# Altium project MVP-Dash-v1.0.PrjPcb (part 8 of 15)

## Sheet DRAM-LPDDR4x-Sheet.SchDoc
size 420 x 297 mm; SheetNumber: 16; SheetTotal: 25
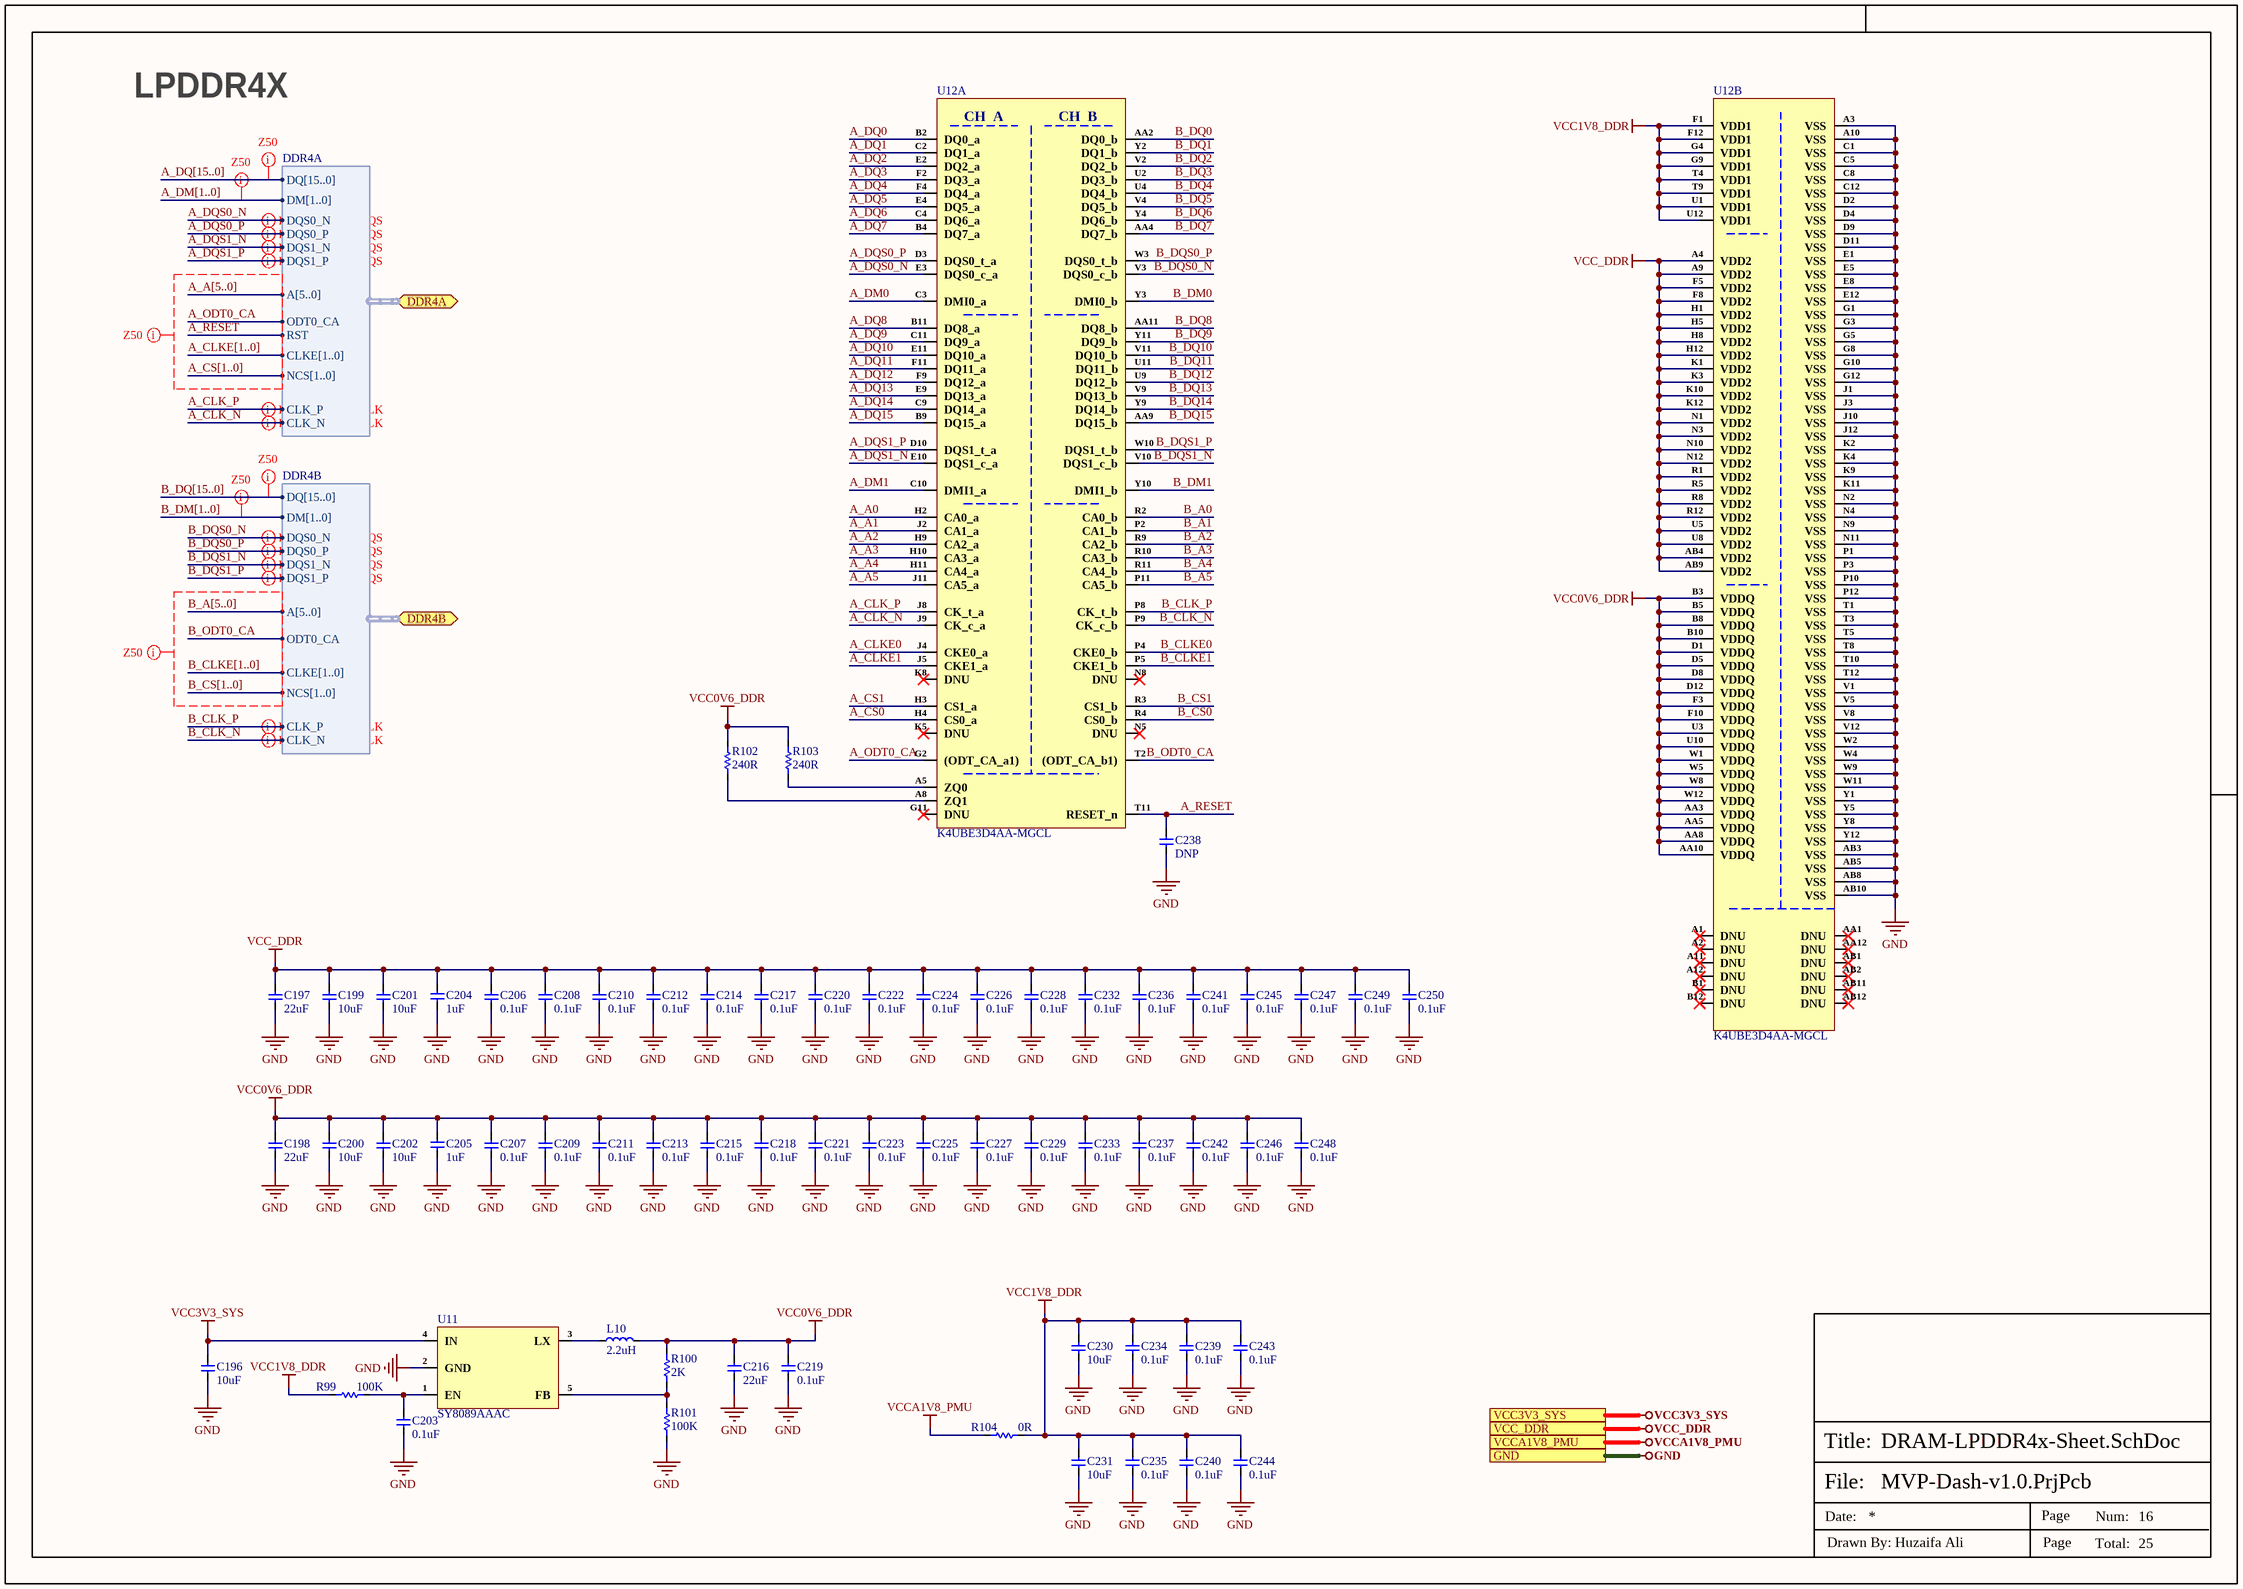
[diagram p20: DRAM-LPDDR4x-Sheet.SchDoc]

### Parts
C196  10uF  [Cap-0603]
C197  22uF  [Cap-0603]
C198  22uF  [Cap-0603]
C199  10uF  [Cap-0603]
C200  10uF  [Cap-0603]
C201  10uF  [Cap-0603]
C202  10uF  [Cap-0603]
C203  0.1uF  [Cap-0402]
C204  1uF  [Cap-0402]
C205  1uF  [Cap-0402]
C206  0.1uF  [Cap-0402]
C207  0.1uF  [Cap-0402]
C208  0.1uF  [Cap-0402]
C209  0.1uF  [Cap-0402]
C210  0.1uF  [Cap-0402]
C211  0.1uF  [Cap-0402]
C212  0.1uF  [Cap-0402]
C213  0.1uF  [Cap-0402]
C214  0.1uF  [Cap-0402]
C215  0.1uF  [Cap-0402]
C216  22uF  [Cap-0603]
C217  0.1uF  [Cap-0402]
C218  0.1uF  [Cap-0402]
C219  0.1uF  [Cap-0402]
C220  0.1uF  [Cap-0402]
C221  0.1uF  [Cap-0402]
C222  0.1uF  [Cap-0402]
C223  0.1uF  [Cap-0402]
C224  0.1uF  [Cap-0402]
C225  0.1uF  [Cap-0402]
C226  0.1uF  [Cap-0402]
C227  0.1uF  [Cap-0402]
C228  0.1uF  [Cap-0402]
C229  0.1uF  [Cap-0402]
C230  10uF  [Cap-0603]
C231  10uF  [Cap-0603]
C232  0.1uF  [Cap-0402]
C233  0.1uF  [Cap-0402]
C234  0.1uF  [Cap-0402]
C235  0.1uF  [Cap-0402]
C236  0.1uF  [Cap-0402]
C237  0.1uF  [Cap-0402]
C238  DNP  [Cap-0402]
C239  0.1uF  [Cap-0402]
C240  0.1uF  [Cap-0402]
C241  0.1uF  [Cap-0402]
C242  0.1uF  [Cap-0402]
C243  0.1uF  [Cap-0402]
C244  0.1uF  [Cap-0402]
C245  0.1uF  [Cap-0402]
C246  0.1uF  [Cap-0402]
C247  0.1uF  [Cap-0402]
C248  0.1uF  [Cap-0402]
C249  0.1uF  [Cap-0402]
C250  0.1uF  [Cap-0402]
L10  2.2uH  [WPN4020H2R2MT_]
R99  100K  [Res-0402]
R100  2K  [Res-0603]
R101  100K  [Res-0402]
R102  240R  [Res-0402]
R103  240R  [Res-0402]
R104  0R  [Res-0402]
U11  SY8089AAAC  [SOT-23-5]
U12  K4UBE3D4AA-MGCL  [200-WFBGA (10x14.5)]  (parts A,B of 2)

### Ports
DDR4A (bidir, harness DDR4A, see RK3568-DDR-PHY[3D]), DDR4B (bidir, harness DDR4B, see RK3568-DDR-PHY[4D]), GND (see Connector-Sheet[5D], eMMC-Sheet[4D], LED-Debug-Sheet[4D], MicroSD-SPI-Flash-Sheet[4D], Power-DC-IN-Sheet[4D], Power-Others-Sheet[4D], Power-PMIC-Sheet[4D], RK3568-Audio-Interface[4D], RK3568-Flash-SD-Controller[4D], RK3568-OSC-PMUIO-Sheet[5D], RK3568-Power-Sheet[4D], RK3568-SARADC-GPIO[4D], RK3568-USB-PCIe-Sheet[5D], RK3568-VI-Interface-Sheet[4D], RK3568-VO-Interface-1[4D], RK3568-VO-Interface-2[4D], Sensors-Sheet-1[4D], Sensors-Sheet-2[5D], Type-C-Sheet[4D], USB-Ports[4D], VO-HDMI2.0-TX-Sheet[4D], VO-LCM-MIPI-DSI-TX0[4D], WIFI-BT-SDIO-Sheet[4D]), VCC3V3_SYS (see Power-DC-IN-Sheet[4D], Power-PMIC-Sheet[3D], RK3568-SARADC-GPIO[4D]), VCC_DDR (see Power-PMIC-Sheet[3D]), VCCA1V8_PMU (see Power-PMIC-Sheet[4D], RK3568-OSC-PMUIO-Sheet[5D])

### Harnesses
DDR4A: DQ[15..0], DM[1..0], DQS0_N, DQS0_P, DQS1_N, DQS1_P, A[5..0], ODT0_CA, RST, CLKE[1..0], NCS[1..0], CLK_P, CLK_N
DDR4B: DQ[15..0], DM[1..0], DQS0_N, DQS0_P, DQS1_N, DQS1_P, A[5..0], ODT0_CA, CLKE[1..0], NCS[1..0], CLK_P, CLK_N

### Nets
GND: C196.1 C197.1 C198.1 C199.1 C200.1 C201.1 C202.1 C203.1 C204.2 C205.2 C206.1 C207.1 C208.1 C209.1 C210.1 C211.1 C212.1 C213.1 C214.1 C215.1 C216.1 C217.1 C218.1 C219.1 C220.1 C221.1 C222.1 C223.1 C224.1 C225.1 C226.1 C227.1 C228.1 C229.1 C230.1 C231.1 C232.1 C233.1 C234.1 C235.1 C236.1 C237.1 C238.1 C239.1 C240.1 C241.1 C242.1 C243.1 C244.1 C245.1 C246.1 C247.1 C248.1 C249.1 C250.1 R101.1 U11.2(GND) U12.A3(VSS) U12.A10(VSS) U12.AB3(VSS) U12.AB5(VSS) U12.AB8(VSS) U12.AB10(VSS) U12.C1(VSS) U12.C5(VSS) U12.C8(VSS) U12.C12(VSS) U12.D2(VSS) U12.D4(VSS) U12.D9(VSS) U12.D11(VSS) U12.E1(VSS) U12.E5(VSS) U12.E8(VSS) U12.E12(VSS) U12.G1(VSS) U12.G3(VSS) U12.G5(VSS) U12.G8(VSS) U12.G10(VSS) U12.G12(VSS) U12.J1(VSS) U12.J3(VSS) U12.J10(VSS) U12.J12(VSS) U12.K2(VSS) U12.K4(VSS) U12.K9(VSS) U12.K11(VSS) U12.N2(VSS) U12.N4(VSS) U12.N9(VSS) U12.N11(VSS) U12.P1(VSS) U12.P3(VSS) U12.P10(VSS) U12.P12(VSS) U12.T1(VSS) U12.T3(VSS) U12.T5(VSS) U12.T8(VSS) U12.T10(VSS) U12.T12(VSS) U12.V1(VSS) U12.V5(VSS) U12.V8(VSS) U12.V12(VSS) U12.W2(VSS) U12.W4(VSS) U12.W9(VSS) U12.W11(VSS) U12.Y1(VSS) U12.Y5(VSS) U12.Y8(VSS) U12.Y12(VSS) ; port GND
VCC0V6_DDR: C198.2 C200.2 C202.2 C205.1 C207.2 C209.2 C211.2 C213.2 C215.2 C216.2 C218.2 C219.2 C221.2 C223.2 C225.2 C227.2 C229.2 C233.2 C237.2 C242.2 C246.2 C248.2 L10.2 R100.2 R102.2 R103.2 U12.AA3(VDDQ) U12.AA5(VDDQ) U12.AA8(VDDQ) U12.AA10(VDDQ) U12.B3(VDDQ) U12.B5(VDDQ) U12.B8(VDDQ) U12.B10(VDDQ) U12.D1(VDDQ) U12.D5(VDDQ) U12.D8(VDDQ) U12.D12(VDDQ) U12.F3(VDDQ) U12.F10(VDDQ) U12.U3(VDDQ) U12.U10(VDDQ) U12.W1(VDDQ) U12.W5(VDDQ) U12.W8(VDDQ) U12.W12(VDDQ)
VCC1V8_DDR: C230.2 C231.2 C234.2 C235.2 C239.2 C240.2 C243.2 C244.2 R99.2 R104.2 U12.F1(VDD1) U12.F12(VDD1) U12.G4(VDD1) U12.G9(VDD1) U12.T4(VDD1) U12.T9(VDD1) U12.U1(VDD1) U12.U12(VDD1)
VCC3V3_SYS: C196.2 U11.4(IN) ; port VCC3V3_SYS
VCC_DDR: C197.2 C199.2 C201.2 C204.1 C206.2 C208.2 C210.2 C212.2 C214.2 C217.2 C220.2 C222.2 C224.2 C226.2 C228.2 C232.2 C236.2 C241.2 C245.2 C247.2 C249.2 C250.2 U12.A4(VDD2) U12.A9(VDD2) U12.AB4(VDD2) U12.AB9(VDD2) U12.F5(VDD2) U12.F8(VDD2) U12.H1(VDD2) U12.H5(VDD2) U12.H8(VDD2) U12.H12(VDD2) U12.K1(VDD2) U12.K3(VDD2) U12.K10(VDD2) U12.K12(VDD2) U12.N1(VDD2) U12.N3(VDD2) U12.N10(VDD2) U12.N12(VDD2) U12.R1(VDD2) U12.R5(VDD2) U12.R8(VDD2) U12.R12(VDD2) U12.U5(VDD2) U12.U8(VDD2) ; port VCC_DDR
VCCA1V8_PMU: R104.1 ; port VCCA1V8_PMU
A_A0: U12.H2(CA0_a)
A_A1: U12.J2(CA1_a)
A_A2: U12.H9(CA2_a)
A_A3: U12.H10(CA3_a)
A_A4: U12.H11(CA4_a)
A_A5: U12.J11(CA5_a)
A_CLK_N: U12.J9(CK_c_a) ; port DDR4A.CLK_N
A_CLK_P: U12.J8(CK_t_a) ; port DDR4A.CLK_P
A_CLKE0: U12.J4(CKE0_a)
A_CLKE1: U12.J5(CKE1_a)
A_CS0: U12.H4(CS0_a)
A_CS1: U12.H3(CS1_a)
A_DM0: U12.C3(DMI0_a)
A_DM1: U12.C10(DMI1_a)
A_DQ0: U12.B2(DQ0_a)
A_DQ1: U12.C2(DQ1_a)
A_DQ2: U12.E2(DQ2_a)
A_DQ3: U12.F2(DQ3_a)
A_DQ4: U12.F4(DQ4_a)
A_DQ5: U12.E4(DQ5_a)
A_DQ6: U12.C4(DQ6_a)
A_DQ7: U12.B4(DQ7_a)
A_DQ8: U12.B11(DQ8_a)
A_DQ9: U12.C11(DQ9_a)
A_DQ10: U12.E11(DQ10_a)
A_DQ11: U12.F11(DQ11_a)
A_DQ12: U12.F9(DQ12_a)
A_DQ13: U12.E9(DQ13_a)
A_DQ14: U12.C9(DQ14_a)
A_DQ15: U12.B9(DQ15_a)
A_DQS0_N: U12.E3(DQS0_c_a) ; port DDR4A.DQS0_N
A_DQS0_P: U12.D3(DQS0_t_a) ; port DDR4A.DQS0_P
A_DQS1_N: U12.E10(DQS1_c_a) ; port DDR4A.DQS1_N
A_DQS1_P: U12.D10(DQS1_t_a) ; port DDR4A.DQS1_P
A_ODT0_CA: U12.G2((ODT_CA_a1)) ; port DDR4A.ODT0_CA
A_RESET: C238.2 U12.T11(RESET_n) ; port DDR4A.RST
B_A0: U12.R2(CA0_b)
B_A1: U12.P2(CA1_b)
B_A2: U12.R9(CA2_b)
B_A3: U12.R10(CA3_b)
B_A4: U12.R11(CA4_b)
B_A5: U12.P11(CA5_b)
B_CLK_N: U12.P9(CK_c_b) ; port DDR4B.CLK_N
B_CLK_P: U12.P8(CK_t_b) ; port DDR4B.CLK_P
B_CLKE0: U12.P4(CKE0_b)
B_CLKE1: U12.P5(CKE1_b)
B_CS0: U12.R4(CS0_b)
B_CS1: U12.R3(CS1_b)
B_DM0: U12.Y3(DMI0_b)
B_DM1: U12.Y10(DMI1_b)
B_DQ0: U12.AA2(DQ0_b)
B_DQ1: U12.Y2(DQ1_b)
B_DQ2: U12.V2(DQ2_b)
B_DQ3: U12.U2(DQ3_b)
B_DQ4: U12.U4(DQ4_b)
B_DQ5: U12.V4(DQ5_b)
B_DQ6: U12.Y4(DQ6_b)
B_DQ7: U12.AA4(DQ7_b)
B_DQ8: U12.AA11(DQ8_b)
B_DQ9: U12.Y11(DQ9_b)
B_DQ10: U12.V11(DQ10_b)
B_DQ11: U12.U11(DQ11_b)
B_DQ12: U12.U9(DQ12_b)
B_DQ13: U12.V9(DQ13_b)
B_DQ14: U12.Y9(DQ14_b)
B_DQ15: U12.AA9(DQ15_b)
B_DQS0_N: U12.V3(DQS0_c_b) ; port DDR4B.DQS0_N
B_DQS0_P: U12.W3(DQS0_t_b) ; port DDR4B.DQS0_P
B_DQS1_N: U12.V10(DQS1_c_b) ; port DDR4B.DQS1_N
B_DQS1_P: U12.W10(DQS1_t_b) ; port DDR4B.DQS1_P
B_ODT0_CA: U12.T2((ODT_CA_b1)) ; port DDR4B.ODT0_CA
NetC203_2: C203.2 R99.1 U11.1(EN)
NetL10_1: L10.1 U11.3(LX)
NetR100_1: R100.1 R101.2 U11.5(FB)
NetR102_1: R102.1 U12.A8(ZQ1)
NetR103_1: R103.1 U12.A5(ZQ0)

Not connected (* = marked no-connect by the designer): U12 A1(DNU)* A2(DNU)* A11(DNU)* A12(DNU)* AA1(DNU)* AA12(DNU)* AB1(DNU)* AB2(DNU)* AB11(DNU)* AB12(DNU)* B1(DNU)* B12(DNU)* G11(DNU)* K5(DNU)* K8(DNU)* N5(DNU)* N8(DNU)*

### Buses and harness runs
bus A_A[5..0]
bus A_CLKE[1..0]
bus A_CS[1..0]
bus A_DM[1..0]
bus A_DQ[15..0]
bus B_A[5..0]
bus B_CLKE[1..0]
bus B_CS[1..0]
bus B_DM[1..0]
bus B_DQ[15..0]

### Layout directives
net class 50OHM_DDR: (no net found under the mark), A_A[5..0], A_CLKE[1..0], A_CS[1..0], A_ODT0_CA, A_RESET, B_A[5..0], B_CLKE[1..0], B_CS[1..0], B_ODT0_CA
differential pair; differential pair class 100OHM_DDR_DQS: A_DQS0_N, A_DQS0_P, A_DQS1_N, A_DQS1_P, B_DQS0_N, B_DQS0_P, B_DQS1_N, B_DQS1_P
differential pair; differential pair class 100OHM_DDR_CLK: A_CLK_N, A_CLK_P, B_CLK_N, B_CLK_P

### Notes on the sheet
- LPDDR4X
- File:
- Title:
- Date:
- Page
- Num:
- Total:
- Drawn By: Huzaifa Ali
- (in symbol K4UBE3D4AA-MGCL, part A) CH  A; CH  B

### Library data of the parts
C196 = CC0603KRX5R6BB106: CAP CER 10UF 10V X5R 0603; Manufacturer: Yageo; Tolerance: 10%; Item Type: Capacitor; Supplier 1: Digi-Key; Manufacturer Part Number: CC0603KRX5R6BB106; RoHS: Yes; Category: Ceramic Capacitors; Stock 1: 187515; Pricing 1: 1=0.24000, 10=0.16300, 50=0.09780, 100=0.08260, 500=0.05654, 1000=0.05001 (USD); Mount: Surface Mount; Case/Package: 0603; Case Code (Metric): 1608; Case Code (Imperial): 0603; Weight: 7.1E-05oz; Min Operating Temperature: -55°C; Max Operating Temperature: 85°C; Capacitance: 10uF; Packaging: Tape and Reel; Dielectric: X5R; Voltage Rating: 10V; Termination: SMD/SMT; Resistor Type: Ceramic; Voltage Rating (DC): 10V; Package Quantity: 4000; Length: 0.063inch; Width: 0.031inch; Thickness: 0.035inch; Depth: 0.8mm; Lead Free: Lead Free; Halogen Free: Halogen Free; RoHS Compliant: Yes; ComponentLink1URL: http://www.mouser.com/ds/2/447/Yageo_UPY-GP_NP0_16V-to-50V_9-358835.pdf?src-supplier=Mouser; ComponentLink1Description: http://www.mouser.com/ds/2/447/Yageo_UPY-GP_NP0_16V-to-50V_9-358835.pdf?src-supplier=Mouser; ComponentLink2URL: http://www.yageo.com/documents/recent/UPY-GPHC_X5R_4V-to-50V_25.pdf?src-supplier=Digi-Key; ComponentLink2Description: http://www.yageo.com/documents/recent/UPY-GPHC_X5R_4V-to-50V_25.pdf?src-supplier=Digi-Key; Supplier Part Number 1: 311-1782-1-ND; LCSC Part Number: C326057
C197 C198 C216 = CC0603MRX5R5BB226: CAP CER 22UF 6.3V X5R 0603; Manufacturer: Yageo; Tolerance: 20%; Supplier 1: Mouser; Manufacturer Part Number: CC0603MRX5R5BB226; RoHS: Yes; Category: Ceramic Capacitors; Stock 1: 3030; Pricing 1: 1=0.33000, 10=0.22500, 50=0.22500, 100=0.12800, 1000=0.07900, 10000=0.06500 (USD); Mount: Surface Mount; Case/Package: 0603; Case Code (Metric): 1608; Case Code (Imperial): 0603; Weight: 7.1E-05oz; Min Operating Temperature: -55°C; Max Operating Temperature: 85°C; Capacitance: 22uF; Packaging: Tape and Reel; Dielectric: X5R; Voltage Rating: 6.3V; Termination: SMD/SMT; Resistor Type: Ceramic; Voltage Rating (DC): 6.3V; Package Quantity: 4000; Length: 0.063inch; Width: 0.031inch; Thickness: 0.035inch; Depth: 0.8mm; Lead Free: Lead Free; Halogen Free: Halogen Free; RoHS Compliant: Yes; ComponentLink1URL: http://www.mouser.com/ds/2/447/Yageo_UPY-GP_NP0_16V-to-50V_9-358835.pdf?src-supplier=Mouser; ComponentLink1Description: http://www.mouser.com/ds/2/447/Yageo_UPY-GP_NP0_16V-to-50V_9-358835.pdf?src-supplier=Mouser; ComponentLink2URL: http://www.yageo.com/documents/recent/UPY-GPHC_X5R_4V-to-50V_25.pdf?src-supplier=Digi-Key; ComponentLink2Description: http://www.yageo.com/documents/recent/UPY-GPHC_X5R_4V-to-50V_25.pdf?src-supplier=Digi-Key; Supplier Part Number 1: 603-CC603MRX5R5BB226; LCSC Part Number: C109448
C199-C202 C230 C231 = GRM188R60J106ME47D: CAP CER 10UF 6.3V X5R 0603; Manufacturer: Murata; Material: Ceramic; Tolerance: 20%; Item Type: Capacitor; Supplier 1: Avnet; Manufacturer Part Number: GRM188R60J106ME47D; RoHS: Yes; Category: Ceramic Capacitors; Stock 1: 513625; Pricing 1: 4000=0.02461, 8000=0.02328, 16000=0.02195, 24000=0.02062, 32000=0.01929, 40000=0.01796, 400000=0.01663 (USD); Mount: Surface Mount; Case/Package: 0603; Case Code (Metric): 1608; Case Code (Imperial): 0603; Weight: 0.000222oz; Min Operating Temperature: -55°C; Max Operating Temperature: 85°C; Capacitance: 10uF; Dielectric: X5R; Packaging: Cut Tape; Package Quantity: 4000; Voltage Rating: 6.3V; Voltage Rating (DC): 6.3V; Termination: Standard; Voltage: 6.3V; Series: GRM; Length: 1.6mm; Width: 0.8mm; Height: 0.8mm; Thickness: 0.035inch; Depth: 0.8mm; Radiation Hardening: No; Reach SVHC Compliant: Yes; Lead Free: Lead Free; RoHS Compliant: Yes; ComponentLink1URL: https://datasheet.ciiva.com/22776/1747457-22776418.pdf?src-supplier=Farnell; ComponentLink1Description: https://datasheet.ciiva.com/22776/1747457-22776418.pdf?src-supplier=Farnell; ComponentLink2URL: https://datasheet.ciiva.com/28584/415295-28584232.pdf?src-supplier=Element14; ComponentLink2Description: https://datasheet.ciiva.com/28584/415295-28584232.pdf?src-supplier=Element14; ComponentLink3URL: https://datasheet.ciiva.com/3777/10175grm188r60j106me4723-3777268.pdf?src-supplier=Arrow+Electronics; ComponentLink3Description: https://datasheet.ciiva.com/3777/10175grm188r60j106me4723-3777268.pdf?src-supplier=Arrow+Electronics; ComponentLink4URL: https://datasheet.ciiva.com/29202/450781-da-01-de-vs-chip-kond-0603-10-0-uf-20pr-6-3v-x5r-29202806.pdf?src-supplier=Conrad; ComponentLink4Description: https://datasheet.ciiva.com/29202/450781-da-01-de-vs-chip-kond-0603-10-0-uf-20pr-6-3v-x5r-29202806.pdf?src-supplier=Conrad; ComponentLink5URL: https://datasheet.ciiva.com/29199/454401-da-01-en-vs-kondensator-0603-29199677.pdf?src-supplier=Conrad; ComponentLink5Description: https://datasheet.ciiva.com/29199/454401-da-01-en-vs-kondensator-0603-29199677.pdf?src-supplier=Conrad; ComponentLink6URL: https://datasheet.ciiva.com/14116/grmseries-highdielectrictype-eng-14116428.pdf?src-supplier=Distrelec; ComponentLink6Description: https://datasheet.ciiva.com/14116/grmseries-highdielectrictype-eng-14116428.pdf?src-supplier=Distrelec; ComponentLink7URL: https://datasheet.ciiva.com/138/partnumbering-e-01-138659.pdf?src-supplier=Digi-Key; ComponentLink7Description: https://datasheet.ciiva.com/138/partnumbering-e-01-138659.pdf?src-supplier=Digi-Key; ComponentLink8URL: https://datasheet.ciiva.com/138/partnumbering-e-01-138658.pdf?src-supplier=Digi-Key; ComponentLink8Description: https://datasheet.ciiva.com/138/partnumbering-e-01-138658.pdf?src-supplier=Digi-Key; ComponentLink9URL: https://datasheet.ciiva.com/138/partnumbering-e-01-138660.pdf?src-supplier=Digi-Key; ComponentLink9Description: https://datasheet.ciiva.com/138/partnumbering-e-01-138660.pdf?src-supplier=Digi-Key; ComponentLink10URL: https://datasheet.ciiva.com/16373/l0005e-16373580.pdf?src-supplier=Future+Electronics; ComponentLink10Description: https://datasheet.ciiva.com/16373/l0005e-16373580.pdf?src-supplier=Future+Electronics; Supplier Part Number 1: GRM188R60J106ME47D; LCSC Part Number: C77041
C203 C206-C215 C217-C229 C232-C237 C239-C250 = CC0402KRX5R6BB104: CAP CER 0.1UF 10V X5R 0402; Manufacturer: Yageo; Capacitance: 100nF; Tolerance: 10%; Dissipation Factor: 5%; Insulation Resistance: 10GR; Item Type: Capacitor; Supplier 1: Digi-Key; Manufacturer Part Number: CC0402KRX5R6BB104; RoHS: Yes; Category: Ceramic Capacitors; Stock 1: 6385580; Pricing 1: 1=0.10000, 10=0.02700, 50=0.01500, 100=0.01220, 500=0.00874, 1000=0.00687, 2500=0.00625, 5000=0.00575 (USD); Mount: Surface Mount; Case/Package: 0402; Number of Pins: 2; Case Code (Imperial): 0402; Case Code (Metric): 1005; Min Operating Temperature: -55°C; Max Operating Temperature: 85°C; Dielectric: X5R; Packaging: Tape and Reel; Voltage Rating: 10V; Package Quantity: 1; Termination: SMD/SMT; Voltage Rating (DC): 10V; Series: CC; Length: 1mm; Width: 0.02inch; Height: 0.5mm; Depth: 0.5mm; Thickness: 0.022inch; Radiation Hardening: No; RoHS Compliant: Yes; REACH SVHC: No SVHC; Lead Free: Lead Free; Halogen Free: Halogen Free; ComponentLink1URL: https://datasheet.ciiva.com/144/mlccorderingcode-144029.pdf?src-supplier=Digi-Key; ComponentLink1Description: https://datasheet.ciiva.com/144/mlccorderingcode-144029.pdf?src-supplier=Digi-Key; ComponentLink2URL: https://datasheet.ciiva.com/144/mlccorderingcode-144028.pdf?src-supplier=Digi-Key; ComponentLink2Description: https://datasheet.ciiva.com/144/mlccorderingcode-144028.pdf?src-supplier=Digi-Key; ComponentLink3URL: https://datasheet.ciiva.com/144/mlccorderingcode-144030.pdf?src-supplier=Digi-Key; ComponentLink3Description: https://datasheet.ciiva.com/144/mlccorderingcode-144030.pdf?src-supplier=Digi-Key; ComponentLink4URL: https://datasheet.ciiva.com/7978/1359354-7978091.pdf?src-supplier=Element14; ComponentLink4Description: https://datasheet.ciiva.com/7978/1359354-7978091.pdf?src-supplier=Element14; ComponentLink5URL: https://datasheet.ciiva.com/11587/upy-gphc-x5r-4v-to-50v-12-11587302.pdf?src-supplier=Avnet; ComponentLink5Description: https://datasheet.ciiva.com/11587/upy-gphc-x5r-4v-to-50v-12-11587302.pdf?src-supplier=Avnet; Supplier Part Number 1: 311-1336-1-ND; LCSC Part Number: C129131
C204 C205 = CC0402KRX5R6BB105: CAP CER 1UF 10V X5R 0402; Manufacturer: Yageo; Tolerance: 10%; Dissipation Factor: 15%; Item Type: Capacitor; Supplier 1: Mouser; Manufacturer Part Number: CC0402KRX5R6BB105; RoHS: Yes; Category: Ceramic Capacitors; Stock 1: 6711367; Pricing 1: 1=0.11000, 10=0.05500, 50=0.05500, 100=0.03300, 500=0.02700, 1000=0.02200, 2500=0.02100, 10000=0.01800 (USD); Mount: Surface Mount; Case/Package: 0402; Number of Pins: 2; Case Code (Metric): 1005; Case Code (Imperial): 0402; Min Operating Temperature: -55°C; Max Operating Temperature: 85°C; Capacitance: 1uF; Dielectric: X5R; Package Quantity: 1; Voltage Rating: 10V; Packaging: Tape and Reel; Voltage Rating (DC): 10V; Termination: SMD/SMT; Resistor Type: Ceramic; Series: CC; Construction: Flat; Length: 1mm; Width: 0.02inch; Height: 0.5mm; Thickness: 0.022inch; Depth: 0.5mm; Radiation Hardening: No; REACH SVHC: No SVHC; Lead Free: Lead Free; Halogen Free: Halogen Free; RoHS Compliant: Yes; ComponentLink1URL: https://datasheet.ciiva.com/176/upy-gphc-x5r-4v-to-50v-12-176704.pdf?src-supplier=Digi-Key; ComponentLink1Description: https://datasheet.ciiva.com/176/upy-gphc-x5r-4v-to-50v-12-176704.pdf?src-supplier=Digi-Key; ComponentLink2URL: https://datasheet.ciiva.com/176/mlccorderingcode-176705.pdf?src-supplier=Digi-Key; ComponentLink2Description: https://datasheet.ciiva.com/176/mlccorderingcode-176705.pdf?src-supplier=Digi-Key; ComponentLink3URL: https://datasheet.ciiva.com/176/mlccorderingcode-176706.pdf?src-supplier=Digi-Key; ComponentLink3Description: https://datasheet.ciiva.com/176/mlccorderingcode-176706.pdf?src-supplier=Digi-Key; Supplier Part Number 1: 603-CC402KRX5R6BB105; LCSC Part Number: C106254
C238 = GRM1555C1H102JA01D: CAP CER 1000PF 50V C0G/NP0 0402; Manufacturer: Murata; Material: Ceramic; Capacitance: 1nF; Tolerance: 5%; Dielectric: C0G; Insulation Resistance: 10GR; Temperature Coefficient: 30ppm/°C; Item Type: Capacitor; Supplier 1: Avnet; Manufacturer Part Number: GRM1555C1H102JA01D; RoHS: Yes; Category: Ceramic Capacitors; Stock 1: 800000; Pricing 1: 10000=0.00648, 20000=0.00613, 40000=0.00578, 60000=0.00543, 80000=0.00508, 100000=0.00473, 1000000=0.00438 (USD); Mount: Surface Mount; Case/Package: 0402; Number of Pins: 2; Case Code (Metric): 1005; Case Code (Imperial): 0402; Dielectric Material: Ceramic; Min Operating Temperature: -55°C; Max Operating Temperature: 125°C; Package Quantity: 1; Voltage Rating: 50V; Packaging: Tape and Reel; Voltage Rating (DC): 50V; Termination: SMD/SMT; Voltage: 50V; Series: GRM; Construction: Flat; Length: 1mm; Width: 0.5mm; Height: 0.5mm; Thickness: 0.022inch; Depth: 0.5mm; Size: 0.5mm; Radiation Hardening: No; Reach SVHC Compliant: Yes; Lead Free: Lead Free; RoHS Compliant: Yes; ComponentLink1URL: https://datasheet.ciiva.com/34302/1855908-34302849.pdf?src-supplier=Jameco; ComponentLink1Description: https://datasheet.ciiva.com/34302/1855908-34302849.pdf?src-supplier=Jameco; ComponentLink2URL: https://datasheet.ciiva.com/132/product-132800.pdf?src-supplier=Digi-Key; ComponentLink2Description: https://datasheet.ciiva.com/132/product-132800.pdf?src-supplier=Digi-Key; ComponentLink3URL: https://datasheet.ciiva.com/132/grm1555c1h102ja01-01-132799.pdf?src-supplier=Digi-Key; ComponentLink3Description: https://datasheet.ciiva.com/132/grm1555c1h102ja01-01-132799.pdf?src-supplier=Digi-Key; ComponentLink4URL: https://datasheet.ciiva.com/11786/0900766b807a1cab-11786727.pdf?src-supplier=RSComponents; ComponentLink4Description: https://datasheet.ciiva.com/11786/0900766b807a1cab-11786727.pdf?src-supplier=RSComponents; ComponentLink5URL: https://datasheet.ciiva.com/29200/453569-da-01-en-vs-kondensator-0402-29200121.pdf?src-supplier=Conrad; ComponentLink5Description: https://datasheet.ciiva.com/29200/453569-da-01-en-vs-kondensator-0402-29200121.pdf?src-supplier=Conrad; ComponentLink6URL: https://datasheet.ciiva.com/7828/4360-7828821.pdf?src-supplier=Element14; ComponentLink6Description: https://datasheet.ciiva.com/7828/4360-7828821.pdf?src-supplier=Element14; ComponentLink7URL: https://datasheet.ciiva.com/14116/grmseries-tc-hitype-eng-14116919.pdf?src-supplier=Distrelec; ComponentLink7Description: https://datasheet.ciiva.com/14116/grmseries-tc-hitype-eng-14116919.pdf?src-supplier=Distrelec; ComponentLink8URL: https://datasheet.ciiva.com/14116/grmseries-tc-hitype-eng-14116858.pdf?src-supplier=Distrelec; ComponentLink8Description: https://datasheet.ciiva.com/14116/grmseries-tc-hitype-eng-14116858.pdf?src-supplier=Distrelec; ComponentLink9URL: https://datasheet.ciiva.com/132/grm1555c1h102ja01-01-132801.pdf?src-supplier=Digi-Key; ComponentLink9Description: https://datasheet.ciiva.com/132/grm1555c1h102ja01-01-132801.pdf?src-supplier=Digi-Key; ComponentLink10URL: https://datasheet.ciiva.com/7828/1747436-7828822.pdf?src-supplier=Element14; ComponentLink10Description: https://datasheet.ciiva.com/7828/1747436-7828822.pdf?src-supplier=Element14; Supplier Part Number 1: GRM1555C1H102JA01D; LCSC Part Number: C76947
L10 = WPN4020H2R2MT: Fixed Ind 2.2UH 4.3A 48MOHM SMD; Manufacturer: Sunlord; Item Type: Inductor; Supplier 1: Digi-Key; Manufacturer Part Number: WPN4020H2R2MT; RoHS: No; Stock 1: 1762; Pricing 1: 1=0.84000, 10=0.73500, 25=0.68240, 50=0.57760, 100=0.52500, 250=0.49352, 500=0.44100, 1000=0.35700 (USD); Supplier Part Number 1: 3442-WPN4020H2R2MTCT-ND; LCSC Part Number: C98361; ComponentLink1Description: LCSC; ComponentLink1URL: https://www.lcsc.com/product-detail/Power-Inductors_Sunlord-WPN4020H2R2MT_C98361.html
R99 = RC0402FR-07100KL: RES 100K OHM 1% 1/16W 0402; Manufacturer: Yageo; Resistance: 100kR; Temperature Coefficient: 100ppm/°C; Power Rating: 63mW; Voltage Rating: 50V; Item Type: Resistor; Supplier 1: Mouser; Manufacturer Part Number: RC0402FR-07100KL; RoHS: Yes; Category: Chip SMD Resistors; Stock 1: 7759549; Pricing 1: 1=0.10000, 10=0.01200, 50=0.01200, 100=0.00500, 1000=0.00300, 2500=0.00200, 10000=0.00100 (USD); Case/Package: 0402; Case Code (Metric): 1005; Case Code (Imperial): 0402; Min Operating Temperature: -55°C; Max Operating Temperature: 155°C; Resistor Type: Thick Film; Tolerance: 1%; Packaging: Tape and Reel; Package Quantity: 1; Number of Terminations: 2; Termination: SMD/SMT; Max Power Dissipation: 63mW; Working Voltage: 50V; Features: Moisture Resistant; Series: RC; Resistance Tolerance: 1%; Construction: Rectangular; Technology: THICK FILM; Length: 0.039inch; Width: 0.02inch; Height: 0.016inch; Depth: 0.5mm; REACH SVHC: No SVHC; Lead Free: Lead Free; RoHS Compliant: Yes; Military Standard: Not; ComponentLink1URL: https://datasheet.ciiva.com/11819/0900766b80c66297-11819452.pdf?src-supplier=RSComponents; ComponentLink1Description: https://datasheet.ciiva.com/11819/0900766b80c66297-11819452.pdf?src-supplier=RSComponents; ComponentLink2URL: https://datasheet.ciiva.com/22747/1018594-22747509.pdf?src-supplier=Element14; ComponentLink2Description: https://datasheet.ciiva.com/22747/1018594-22747509.pdf?src-supplier=Element14; ComponentLink3URL: https://datasheet.ciiva.com/2453/pyu-r-int-thick-7-2453362.pdf?src-supplier=Digi-Key; ComponentLink3Description: https://datasheet.ciiva.com/2453/pyu-r-int-thick-7-2453362.pdf?src-supplier=Digi-Key; ComponentLink4URL: https://datasheet.ciiva.com/2453/pyu-r-int-thick-7-2453363.pdf?src-supplier=Digi-Key; ComponentLink4Description: https://datasheet.ciiva.com/2453/pyu-r-int-thick-7-2453363.pdf?src-supplier=Digi-Key; ComponentLink5URL: https://datasheet.ciiva.com/2453/pyu-r-int-thick-7-2453361.pdf?src-supplier=Digi-Key; ComponentLink5Description: https://datasheet.ciiva.com/2453/pyu-r-int-thick-7-2453361.pdf?src-supplier=Digi-Key; ComponentLink6URL: https://datasheet.ciiva.com/12667/pyu-rc0402-51-rohs-l-6-r-12667930.pdf?src-supplier=Mouser; ComponentLink6Description: https://datasheet.ciiva.com/12667/pyu-rc0402-51-rohs-l-6-r-12667930.pdf?src-supplier=Mouser; ComponentLink7URL: https://datasheet.ciiva.com/15189/getdatasheetpartid-323696-15189334.pdf?src-supplier=Verical; ComponentLink7Description: https://datasheet.ciiva.com/15189/getdatasheetpartid-323696-15189334.pdf?src-supplier=Verical; Supplier Part Number 1: 603-RC0402FR-07100KL; LCSC Part Number: C60491
R100 = RT0603BRE072KL: RES SMD 2K OHM 0.1% 1/10W 0603; Manufacturer: Yageo; Resistance: 2kR; Power Rating: 100mW; Temperature Coefficient: 50ppm/°C; Voltage Rating (DC): 50V; Item type: Resistor; Supplier 1: Future Electronics; Manufacturer Part Number: RT0603BRE072KL; RoHS: Yes; Category: Chip SMD Resistors; Stock 1: 85000; Pricing 1: 5000=0.03240, 15000=0.03120, 20000=0.03090, 50000=0.02990, 75000=0.02900 (USD); Case/Package: 0603; Case Code (Metric): 1608; Case Code (Imperial): 0603; Size Code: 0603; Min Operating Temperature: -55°C; Max Operating Temperature: 155°C; Package Quantity: 5000; Packaging: Tape and Reel; Tolerance: 0.1%; Resistor Type: Thin Film; Number of Terminations: 2; Max Power Dissipation: 100mW; Features: Moisture Resistant; Series: RT; Construction: Rectangular; Length: 0.063inch; Width: 0.031inch; Height: 0.022inch; Depth: 0.8mm; Military Standard: Not; Lead Free: Lead Free; RoHS Compliant: Yes; ComponentLink1URL: https://datasheet.ciiva.com/2584/pyu-rt-1-to-0-05-rohs-l-5-2584417.pdf?src-supplier=Digi-Key; ComponentLink1Description: https://datasheet.ciiva.com/2584/pyu-rt-1-to-0-05-rohs-l-5-2584417.pdf?src-supplier=Digi-Key; Supplier Part Number 1: 8298309; LCSC Part Number: C136954
R101 = RT0402BRD07100KL: RES SMD 100K OHM 0.1% 1/16W 0402; Manufacturer: Yageo; Voltage Rating (DC): 50V; Item Type: Resistor; Supplier: Digikey; Supplier Part Number: YAG1343CT-ND; Manufacturer Part Number: RT0402BRD07100KL; RoHS: Yes; Category: Chip SMD Resistors; Stock: 62932; Pricing: 1=0.16, 10=0.121, 50=0.0958, 100=0.0859, 500=0.0654, 1000=0.0578, 5000=0.04283 (USD); ComponentLink1URL: https://datasheet.ciiva.com/12724/pyu-rt-1-to-0-05-rohs-l-4-12724954.pdf?src-supplier=Mouser; ComponentLink1Description: https://datasheet.ciiva.com/12724/pyu-rt-1-to-0-05-rohs-l-4-12724954.pdf?src-supplier=Mouser; LCSC Part Number: C852472
R102 R103 = RC0402FR-07240RL: RES 240 OHM 1% 1/16W 0402; Manufacturer: Yageo; Power Rating: 63mW; Temperature Coefficient: 100ppm/°C; Voltage Rating (DC): 50V; Supplier 1: Mouser; Manufacturer Part Number: RC0402FR-07240RL; RoHS: Yes; Category: Chip SMD Resistors; Stock 1: 1903202; Pricing 1: 1=0.10000, 10=0.01200, 50=0.01200, 100=0.00500, 1000=0.00300, 10000=0.00100 (USD); Case/Package: 0402; Case Code (Metric): 1005; Case Code (Imperial): 0402; Size Code: 0402; Min Operating Temperature: -55°C; Max Operating Temperature: 155°C; Resistance: 240R; Tolerance: 1%; Packaging: Tape and Reel; Resistor Type: Thick Film; Voltage Rating: 50V; Package Quantity: 1; Number of Terminations: 2; Termination: SMD/SMT; Max Power Dissipation: 63mW; Features: Moisture Resistant; Series: RC; Construction: Rectangular; Resistance Tolerance: 1%; Length: 1mm; Width: 0.02inch; Height: 0.016inch; Depth: 0.5mm; REACH SVHC: Unknown; Lead Free: Lead Free; RoHS Compliant: Yes; Military Standard: Not; ComponentLink1URL: https://datasheet.ciiva.com/7849/1018594-7849915.pdf?src-supplier=Element14; ComponentLink1Description: https://datasheet.ciiva.com/7849/1018594-7849915.pdf?src-supplier=Element14; ComponentLink2URL: https://datasheet.ciiva.com/7849/1018594-7849916.pdf?src-supplier=Element14; ComponentLink2Description: https://datasheet.ciiva.com/7849/1018594-7849916.pdf?src-supplier=Element14; ComponentLink3URL: https://datasheet.ciiva.com/2519/pyu-r-int-thick-7-2519157.pdf?src-supplier=Digi-Key; ComponentLink3Description: https://datasheet.ciiva.com/2519/pyu-r-int-thick-7-2519157.pdf?src-supplier=Digi-Key; ComponentLink4URL: https://datasheet.ciiva.com/2519/pyu-r-int-thick-7-2519158.pdf?src-supplier=Digi-Key; ComponentLink4Description: https://datasheet.ciiva.com/2519/pyu-r-int-thick-7-2519158.pdf?src-supplier=Digi-Key; ComponentLink5URL: https://datasheet.ciiva.com/2519/pyu-r-int-thick-7-2519156.pdf?src-supplier=Digi-Key; ComponentLink5Description: https://datasheet.ciiva.com/2519/pyu-r-int-thick-7-2519156.pdf?src-supplier=Digi-Key; ComponentLink6URL: https://datasheet.ciiva.com/12669/pyu-rc0402-51-rohs-l-6-r-12669689.pdf?src-supplier=Mouser; ComponentLink6Description: https://datasheet.ciiva.com/12669/pyu-rc0402-51-rohs-l-6-r-12669689.pdf?src-supplier=Mouser; ComponentLink7URL: https://datasheet.ciiva.com/17419/pyu-rc0402-51-rohs-l-6-r-17419482.pdf?src-supplier=Future+Electronics; ComponentLink7Description: https://datasheet.ciiva.com/17419/pyu-rc0402-51-rohs-l-6-r-17419482.pdf?src-supplier=Future+Electronics; Supplier Part Number 1: 603-RC0402FR-07240RL
R104 = RC0402FR-070RL: RES 0 OHM JUMPER 1/16W 0402; Manufacturer: Yageo; Tolerance: 1%; Power Rating: 62.5mW; Voltage Rating: 50V; Temperature Coefficient: 200ppm/°C; Max Power Dissipation: 63mW; Supplier 1: Mouser; Manufacturer Part Number: RC0402FR-070RL; RoHS: Yes; Category: Chip SMD Resistors; Stock 1: 8556842; Pricing 1: 1=0.10000, 10=0.01400, 50=0.01400, 100=0.00600, 1000=0.00300, 5000=0.00200, 10000=0.00100 (USD); Mount: Surface Mount; Case/Package: 0402; Contact Plating: Tin,Matte; Case Code (Imperial): 0402; Case Code (Metric): 1005; Size Code: 0402; Min Operating Temperature: -55°C; Max Operating Temperature: 155°C; Resistance: 0R; Resistor Type: Thick Film; Packaging: Tape and Reel; Termination: SMD/SMT; Features: Moisture Resistant; Series: RC; Number of Terminations: 2; Length: 1mm; Width: 0.5mm; Height: 0.35mm; Radiation Hardening: No; Lead Free: Lead Free; RoHS Compliant: Yes; ComponentLink1URL: https://datasheet.ciiva.com/8896/pyu-rc0402-51-rohs-l-6-8896149.pdf?src-supplier=Avnet; ComponentLink1Description: https://datasheet.ciiva.com/8896/pyu-rc0402-51-rohs-l-6-8896149.pdf?src-supplier=Avnet; ComponentLink2URL: https://datasheet.ciiva.com/16790/pyu-rc0402-51-rohs-l-6-r-16790444.pdf?src-supplier=Future+Electronics; ComponentLink2Description: https://datasheet.ciiva.com/16790/pyu-rc0402-51-rohs-l-6-r-16790444.pdf?src-supplier=Future+Electronics; Supplier Part Number 1: 603-RC0402FR-070RL; LCSC Part Number: C106231
U11 = SY8089AAAC: Step-down type SOT-23-5 DC-DC Converters ROHS; Manufacturer: Silergy; Item Type: IC; Supplier 1: LCSC; Manufacturer Part Number: SY8089AAAC; RoHS: No; Supplier Part Number 1: C78988; LCSC Part Number: C78988; ComponentLink1Description: LCSC; ComponentLink1URL: https://www.lcsc.com/product-detail/DC-DC-Converters_Silergy-Corp-SY8089AAAC_C78988.html
U12 = K4UBE3D4AA-MGCL: FBGA-200 DDR SDRAM ROHS; Manufacturer: Samsung; Item Type: IC; Manufacturer Part Number: K4UBE3D4AA-MGCL; Package: FBGA-200; LCSC Part Number: C2920257; ComponentLink1Description: LCSC; ComponentLink1URL: https://www.lcsc.com/product-detail/DDR-SDRAM_Samsung-K4UBE3D4AA-MGCL_C2920257.html

## Sheet eMMC-Sheet.SchDoc
size 420 x 297 mm; SheetNumber: 17; SheetTotal: 25
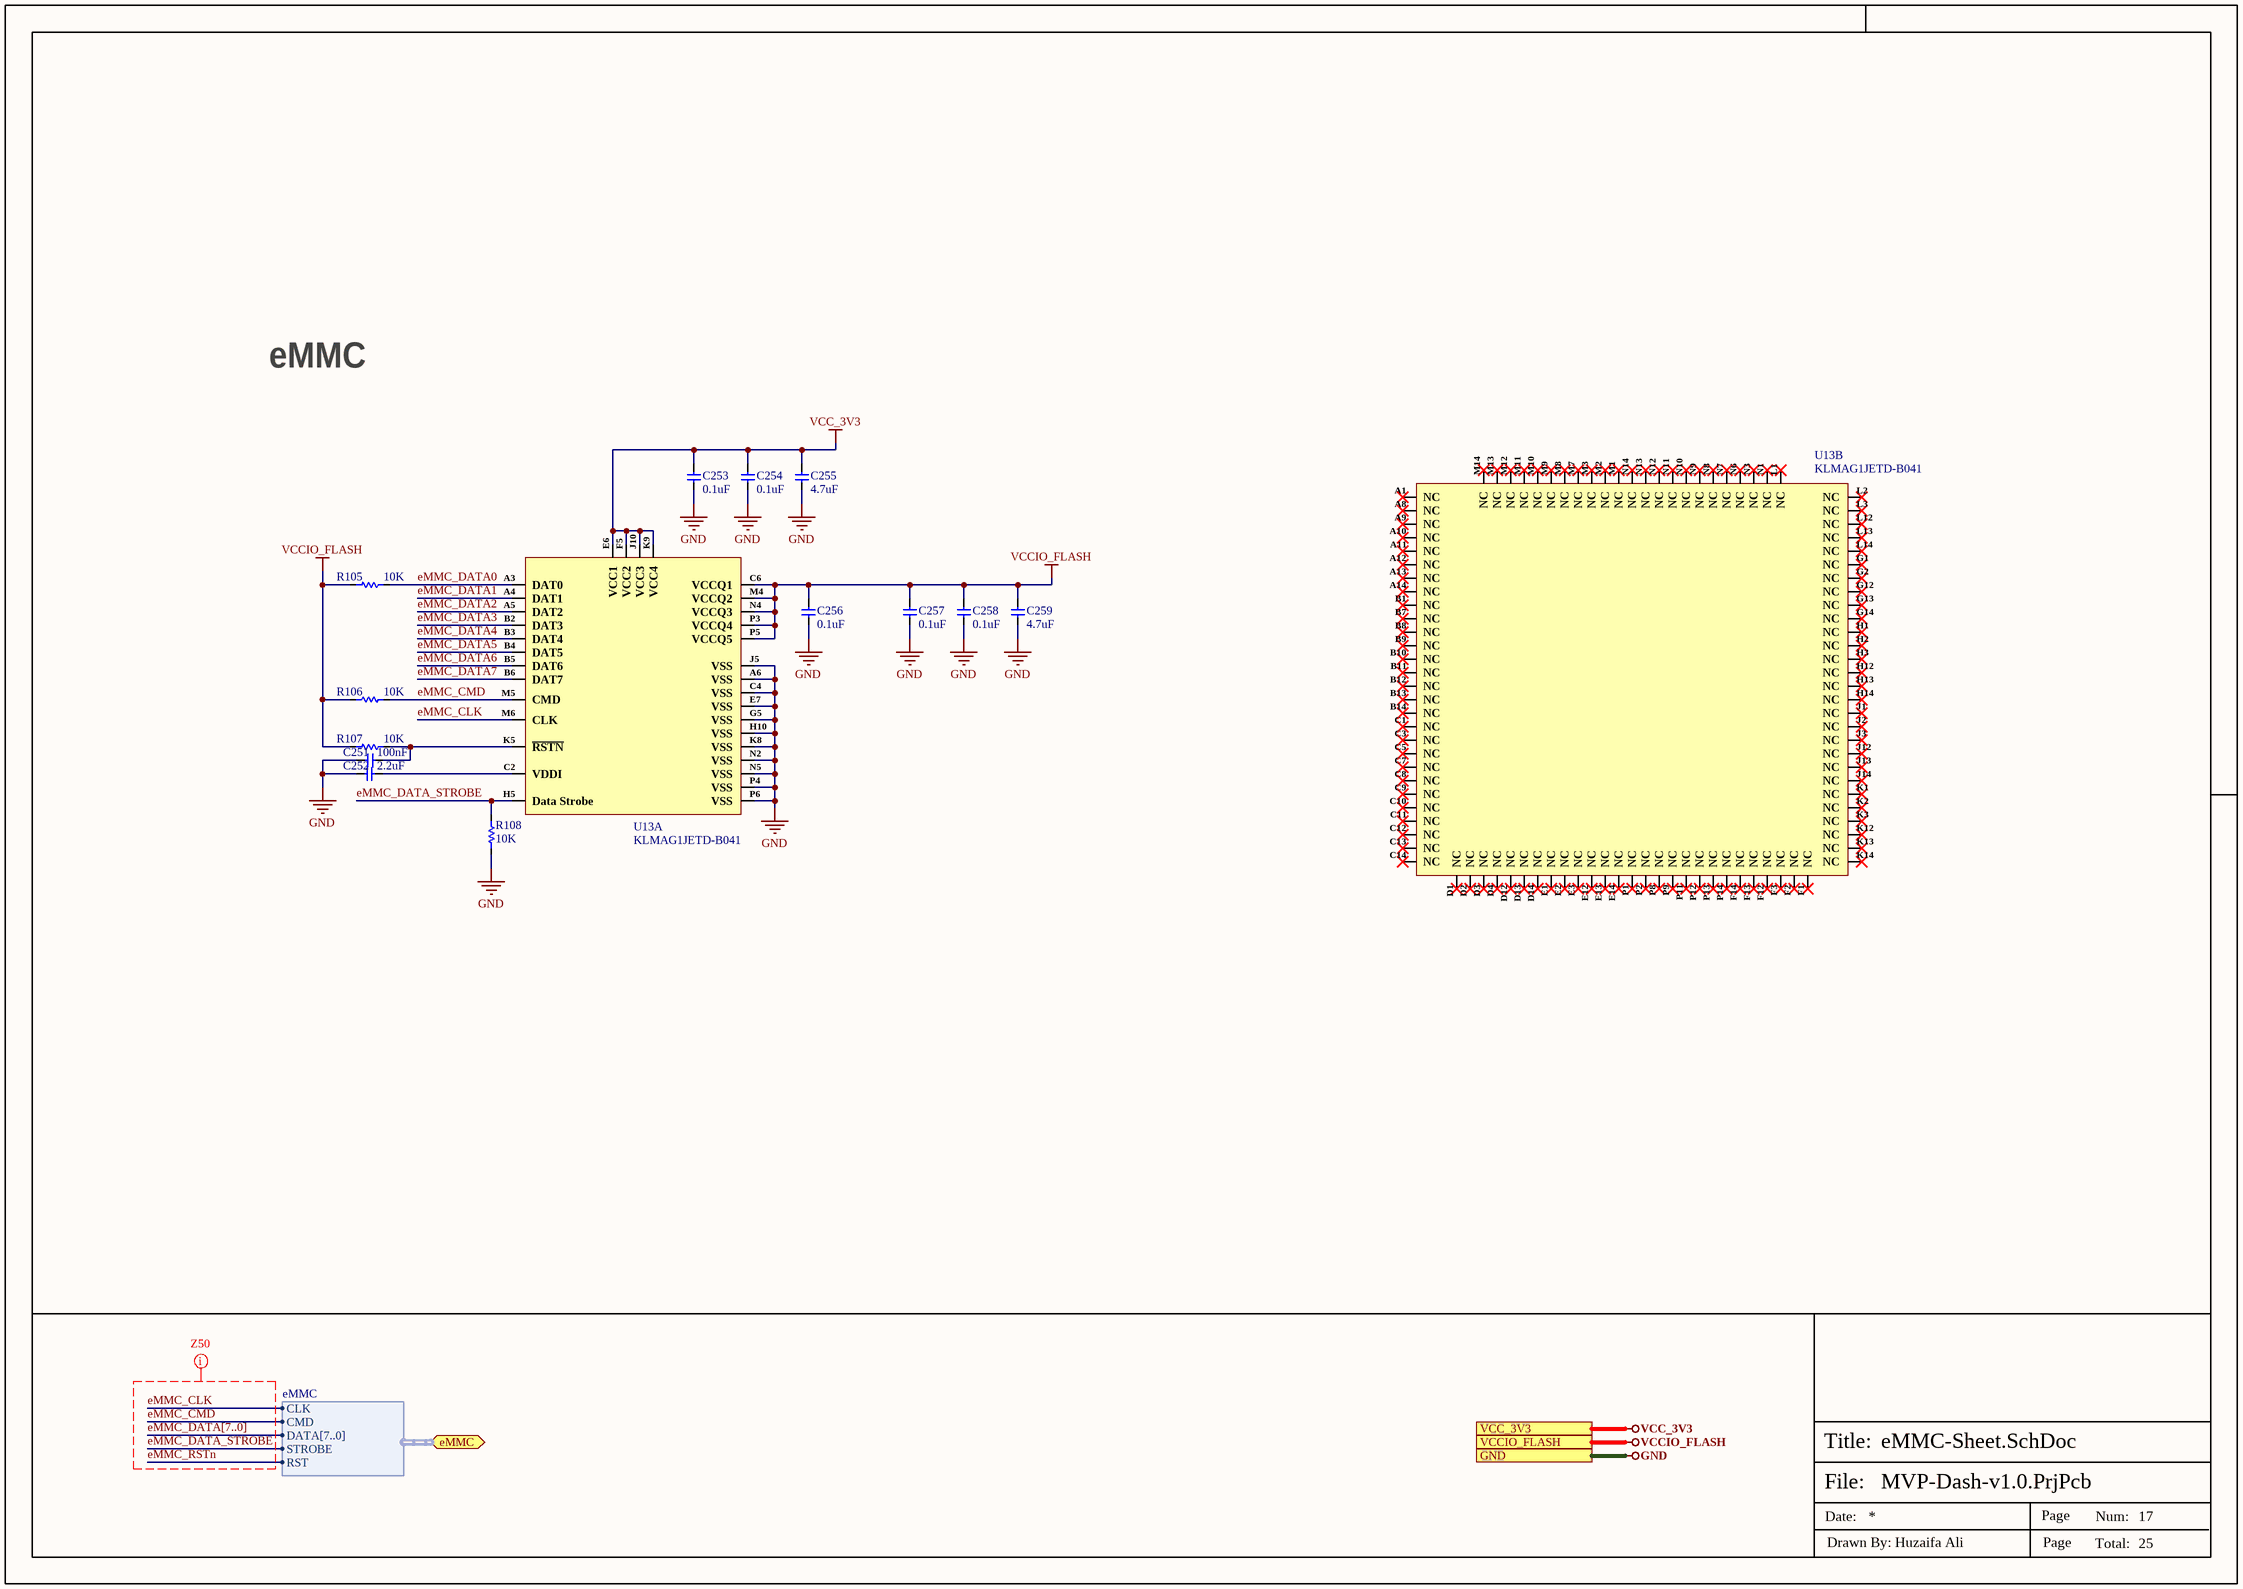
[diagram p21: eMMC-Sheet.SchDoc]

### Parts
C251  100nF  [CAP-0201]
C252  2.2uF  [Cap-0402]
C253  0.1uF  [Cap-0402]
C254  0.1uF  [Cap-0402]
C255  4.7uF  [Cap-0402]
C256  0.1uF  [Cap-0402]
C257  0.1uF  [Cap-0402]
C258  0.1uF  [Cap-0402]
C259  4.7uF  [Cap-0402]
R105  10K  [Res-0402]
R106  10K  [Res-0402]
R107  10K  [Res-0402]
R108  10K  [Res-0402]
U13  KLMAG1JETD-B041  [FBGA-153(11.5x13)]  (parts A,B of 2)

### Ports
eMMC (bidir, harness eMMC, see RK3568-Flash-SD-Controller[5A]), GND (see Connector-Sheet[5D], DRAM-LPDDR4x-Sheet[4D], LED-Debug-Sheet[4D], MicroSD-SPI-Flash-Sheet[4D], Power-DC-IN-Sheet[4D], Power-Others-Sheet[4D], Power-PMIC-Sheet[4D], RK3568-Audio-Interface[4D], RK3568-Flash-SD-Controller[4D], RK3568-OSC-PMUIO-Sheet[5D], RK3568-Power-Sheet[4D], RK3568-SARADC-GPIO[4D], RK3568-USB-PCIe-Sheet[5D], RK3568-VI-Interface-Sheet[4D], RK3568-VO-Interface-1[4D], RK3568-VO-Interface-2[4D], Sensors-Sheet-1[4D], Sensors-Sheet-2[5D], Type-C-Sheet[4D], USB-Ports[4D], VO-HDMI2.0-TX-Sheet[4D], VO-LCM-MIPI-DSI-TX0[4D], WIFI-BT-SDIO-Sheet[4D]), VCC_3V3 (see Power-PMIC-Sheet[4D], RK3568-SARADC-GPIO[4D], RK3568-USB-PCIe-Sheet[5D], RK3568-VO-Interface-2[4D], VO-HDMI2.0-TX-Sheet[4D], WIFI-BT-SDIO-Sheet[4D]), VCCIO_FLASH (see MicroSD-SPI-Flash-Sheet[4D], Power-Others-Sheet[4D], RK3568-Flash-SD-Controller[4D])

### Harnesses
eMMC: DATA[7..0], STROBE, CLK, CMD, RST

### Nets
GND: C251.2 C252.1 C253.1 C254.1 C255.1 C256.1 C257.1 C258.1 C259.1 R108.1 U13.A6(VSS) U13.C4(VSS) U13.E7(VSS) U13.G5(VSS) U13.H10(VSS) U13.J5(VSS) U13.K8(VSS) U13.N2(VSS) U13.N5(VSS) U13.P4(VSS) U13.P6(VSS) ; port GND
VCC_3V3: C253.2 C254.2 C255.2 U13.E6(VCC1) U13.F5(VCC2) U13.J10(VCC3) U13.K9(VCC4) ; port VCC_3V3
VCCIO_FLASH: C256.2 C257.2 C258.2 C259.2 R105.1 R106.1 R107.1 U13.C6(VCCQ1) U13.M4(VCCQ2) U13.N4(VCCQ3) U13.P3(VCCQ4) U13.P5(VCCQ5) ; port VCCIO_FLASH
eMMC_CLK: U13.M6(CLK) ; port eMMC.CLK
eMMC_CMD: R106.2 U13.M5(CMD) ; port eMMC.CMD
eMMC_DATA0: R105.2 U13.A3(DAT0)
eMMC_DATA1: U13.A4(DAT1)
eMMC_DATA2: U13.A5(DAT2)
eMMC_DATA3: U13.B2(DAT3)
eMMC_DATA4: U13.B3(DAT4)
eMMC_DATA5: U13.B4(DAT5)
eMMC_DATA6: U13.B5(DAT6)
eMMC_DATA7: U13.B6(DAT7)
eMMC_DATA_STROBE: R108.2 U13.H5(Data_Strobe) ; port eMMC.STROBE
NetC251_1: C251.1 R107.2 U13.K5(~{RSTN})
NetC252_2: C252.2 U13.C2(VDDI)

Not connected (* = marked no-connect by the designer): U13 A1(NC)* A8(NC)* A9(NC)* A10(NC)* A11(NC)* A12(NC)* A13(NC)* A14(NC)* B1(NC)* B7(NC)* B8(NC)* B9(NC)* B10(NC)* B11(NC)* B12(NC)* B13(NC)* B14(NC)* C1(NC)* C3(NC)* C5(NC)* C7(NC)* C8(NC)* C9(NC)* C10(NC)* C11(NC)* C12(NC)* C13(NC)* C14(NC)* D1(NC)* D2(NC)* D3(NC)* D4(NC)* D12(NC)* D13(NC)* D14(NC)* E1(NC)* E2(NC)* E3(NC)* E12(NC)* E13(NC)* E14(NC)* F1(NC)* F2(NC)* F3(NC)* F12(NC)* F13(NC)* F14(NC)* G1(NC)* G2(NC)* G12(NC)* G13(NC)* G14(NC)* H1(NC)* H2(NC)* H3(NC)* H12(NC)* H13(NC)* H14(NC)* J1(NC)* J2(NC)* J3(NC)* J12(NC)* J13(NC)* J14(NC)* K1(NC)* K2(NC)* K3(NC)* K12(NC)* K13(NC)* K14(NC)* L1(NC)* L2(NC)* L3(NC)* L12(NC)* L13(NC)* L14(NC)* M1(NC)* M2(NC)* M3(NC)* M7(NC)* M8(NC)* M9(NC)* M10(NC)* M11(NC)* M12(NC)* M13(NC)* M14(NC)* N1(NC)* N3(NC)* N6(NC)* N7(NC)* N8(NC)* N9(NC)* N10(NC)* N11(NC)* N12(NC)* N13(NC)* N14(NC)* P1(NC)* P2(NC)* P8(NC)* P9(NC)* P11(NC)* P12(NC)* P13(NC)* P14(NC)*

### Buses and harness runs
bus eMMC_DATA[7..0]

### Layout directives
net class 50OHM_DDR: eMMC_CLK, eMMC_CMD, eMMC_DATA[7..0], eMMC_DATA_STROBE, eMMC_RSTn

### Notes on the sheet
- eMMC
- File:
- Title:
- Date:
- Page
- Num:
- Total:
- Drawn By: Huzaifa Ali

### Library data of the parts
C251 = CC0201KRX5R6BB104: CAP CER 0.1UF 10V X5R 0201; Manufacturer: Yageo; Tolerance: 10%; Supplier 1: Mouser; Manufacturer Part Number: CC0201KRX5R6BB104; RoHS: Yes; Category: Ceramic Capacitors; Stock 1: 824403; Pricing 1: 1=0.10000, 10=0.02400, 50=0.02400, 100=0.01900, 1000=0.01100, 10000=0.00900 (USD); Mount: Surface Mount; Case/Package: 0201; Case Code (Imperial): 0201; Case Code (Metric): 0603; Weight: 6E-06oz; Min Operating Temperature: -55°C; Max Operating Temperature: 85°C; Capacitance: 100nF; Dielectric: X5R; Voltage Rating (DC): 10V; Packaging: Tape and Reel; Termination: SMD/SMT; Resistor Type: Ceramic; Voltage Rating: 10V; Series: CC; Construction: Flat; Length: 0.6mm; Width: 0.012inch; Height: 0.3mm; Thickness: 0.013inch; Depth: 0.3mm; Radiation Hardening: No; Lead Free: Lead Free; Halogen Free: Halogen Free; RoHS Compliant: Yes; ComponentLink1URL: https://datasheet.ciiva.com/11587/upy-gphc-x5r-4v-to-50v-12-11587190.pdf?src-supplier=Avnet; ComponentLink1Description: https://datasheet.ciiva.com/11587/upy-gphc-x5r-4v-to-50v-12-11587190.pdf?src-supplier=Avnet; Supplier Part Number 1: 603-CC201KRX5R6BB104; LCSC Part Number: C190183
C252 = C1005X5R0J225KTJA0E: CAP CER 2.2UF 6.3V X5R 0402; Manufacturer: TDK; Item Type: Capacitor; LCSC Part Number: C343036; Manufacturer Part Number: C1005X5R0J225KTJA0E; ComponentLink1Description: LCSC; ComponentLink1URL: https://www.lcsc.com/product-detail/Multilayer-Ceramic-Capacitors-MLCC-SMD-SMT_TDK-C1005X5R0J225KTJA0E_C343036.html
C253 C254 C256-C258 = CC0402KRX5R6BB104: as C203 on sheet DRAM-LPDDR4x-Sheet; Supplier 1: Digi-Key; Manufacturer Part Number: CC0402KRX5R6BB104; RoHS: Yes; Category: Ceramic Capacitors; Stock 1: 6385580; Pricing 1: 1=0.10000, 10=0.02700, 50=0.01500, 100=0.01220, 500=0.00874, 1000=0.00687, 2500=0.00625, 5000=0.00575 (USD); Mount: Surface Mount; Case/Package: 0402; Number of Pins: 2; Case Code (Imperial): 0402; Case Code (Metric): 1005; Min Operating Temperature: -55°C; Max Operating Temperature: 85°C; Dielectric: X5R; Packaging: Tape and Reel; Voltage Rating: 10V; Package Quantity: 1; Termination: SMD/SMT; Voltage Rating (DC): 10V; Series: CC; Length: 1mm; Width: 0.02inch; Height: 0.5mm; Depth: 0.5mm; Thickness: 0.022inch; Radiation Hardening: No; RoHS Compliant: Yes; REACH SVHC: No SVHC; Lead Free: Lead Free; Halogen Free: Halogen Free; ComponentLink1URL: https://datasheet.ciiva.com/144/mlccorderingcode-144029.pdf?src-supplier=Digi-Key; ComponentLink1Description: https://datasheet.ciiva.com/144/mlccorderingcode-144029.pdf?src-supplier=Digi-Key; ComponentLink2URL: https://datasheet.ciiva.com/144/mlccorderingcode-144028.pdf?src-supplier=Digi-Key; ComponentLink2Description: https://datasheet.ciiva.com/144/mlccorderingcode-144028.pdf?src-supplier=Digi-Key; ComponentLink3URL: https://datasheet.ciiva.com/144/mlccorderingcode-144030.pdf?src-supplier=Digi-Key; ComponentLink3Description: https://datasheet.ciiva.com/144/mlccorderingcode-144030.pdf?src-supplier=Digi-Key; ComponentLink4URL: https://datasheet.ciiva.com/7978/1359354-7978091.pdf?src-supplier=Element14; ComponentLink4Description: https://datasheet.ciiva.com/7978/1359354-7978091.pdf?src-supplier=Element14; ComponentLink5URL: https://datasheet.ciiva.com/11587/upy-gphc-x5r-4v-to-50v-12-11587302.pdf?src-supplier=Avnet; ComponentLink5Description: https://datasheet.ciiva.com/11587/upy-gphc-x5r-4v-to-50v-12-11587302.pdf?src-supplier=Avnet; Supplier Part Number 1: 311-1336-1-ND; LCSC Part Number: C129131
C255 C259 = CC0402KRX5R6BB475: CAP CER 4.7UF 10V X5R 0402; Manufacturer: Yageo; Tolerance: 10%; Supplier 1: Farnell; Manufacturer Part Number: CC0402KRX5R6BB475; RoHS: Yes; Category: Ceramic Capacitors; Stock 1: 20000; Pricing 1: 10000=0.02310, 50000=0.02100 (GBP); Mount: Surface Mount; Case/Package: 0402; Case Code (Imperial): 0402; Case Code (Metric): 1005; Min Operating Temperature: -55°C; Max Operating Temperature: 85°C; Packaging: Cut Tape; Capacitance: 4.7uF; Voltage Rating: 10V; RoHS Compliant: Yes; ComponentLink1URL: http://www.yageo.com/documents/recent/UPY-GPHC_X5R_4V-to-50V_25.pdf?src-supplier=Digi-Key; ComponentLink1Description: http://www.yageo.com/documents/recent/UPY-GPHC_X5R_4V-to-50V_25.pdf?src-supplier=Digi-Key; Supplier Part Number 1: 3871698; LCSC Part Number: C326586
R105-R108 = RC0402FR-0710KL: RES 10K OHM 1% 1/16W 0402; Manufacturer: Yageo; Resistance: 10kR; Voltage Rating (DC): 50V; Temperature Coefficient: 100ppm/°C; Power Rating: 62.5mW; Max Power Dissipation: 63mW; Item Type: Resistor; Supplier 1: Mouser; Manufacturer Part Number: RC0402FR-0710KL; RoHS: Yes; Category: Chip SMD Resistors; Stock 1: 18648329; Pricing 1: 1=0.10000, 10=0.01400, 50=0.01400, 100=0.00500, 1000=0.00300, 10000=0.00200 (USD); Case/Package: 0402; Number of Pins: 2; Case Code (Imperial): 0402; Case Code (Metric): 1005; Min Operating Temperature: -55°C; Max Operating Temperature: 155°C; Resistor Type: Thick Film; Tolerance: 1%; Packaging: Tape and Reel; Voltage Rating: 50V; Termination: SMD/SMT; Working Voltage: 50V; Number of Terminations: 2; Features: Moisture Resistant; Series: RC; Resistance Tolerance: 1%; Construction: Rectangular; Length: 1mm; Width: 0.5mm; Height: 0.32mm; Depth: 0.5mm; Lead Pitch: 0.2mm; REACH SVHC: No SVHC; Lead Free: Lead Free; RoHS Compliant: Yes; Military Standard: Not; ComponentLink1URL: https://datasheet.ciiva.com/7660/38568-7660787.pdf?src-supplier=Element14; ComponentLink1Description: https://datasheet.ciiva.com/7660/38568-7660787.pdf?src-supplier=Element14; ComponentLink2URL: https://datasheet.ciiva.com/7849/1686128-7849814.pdf?src-supplier=Element14; ComponentLink2Description: https://datasheet.ciiva.com/7849/1686128-7849814.pdf?src-supplier=Element14; ComponentLink3URL: https://datasheet.ciiva.com/7983/1018594-7983486.pdf?src-supplier=Element14; ComponentLink3Description: https://datasheet.ciiva.com/7983/1018594-7983486.pdf?src-supplier=Element14; ComponentLink4URL: https://datasheet.ciiva.com/22747/1018594-22747512.pdf?src-supplier=Element14; ComponentLink4Description: https://datasheet.ciiva.com/22747/1018594-22747512.pdf?src-supplier=Element14; ComponentLink5URL: https://datasheet.ciiva.com/12667/pyu-rc0402-51-rohs-l-6-r-12667067.pdf?src-supplier=Mouser; ComponentLink5Description: https://datasheet.ciiva.com/12667/pyu-rc0402-51-rohs-l-6-r-12667067.pdf?src-supplier=Mouser; ComponentLink6URL: https://datasheet.ciiva.com/7849/1784430-7849813.pdf?src-supplier=Element14; ComponentLink6Description: https://datasheet.ciiva.com/7849/1784430-7849813.pdf?src-supplier=Element14; ComponentLink7URL: https://datasheet.ciiva.com/7849/1784430-7849815.pdf?src-supplier=Element14; ComponentLink7Description: https://datasheet.ciiva.com/7849/1784430-7849815.pdf?src-supplier=Element14; Supplier Part Number 1: 603-RC0402FR-0710KL; LCSC Part Number: C60490
U13 = KLMAG1JETD-B041: eMMC 5.1 FBGA-153 eMMC ROHS; Manufacturer: Samsung; Item Type: IC; Manufacturer Part Number: KLMAG1JETD-B041; Package: FBGA-153; LCSC Part Number: C499919; ComponentLink1Description: LCSC; ComponentLink1URL: https://www.lcsc.com/product-detail/eMMC_Samsung-KLMAG1JETD-B041_C499919.html